# Altium schematic sheet Project_Overview.SchDoc
size A4; Organization: Arribada Initiative; Address1: https://github.com/arribada; Address2: contact@arribada.org; Address3: arribada.org; Address4: UK - Portsmouth; DocumentNumber: 1; SheetNumber: 1; SheetTotal: 5
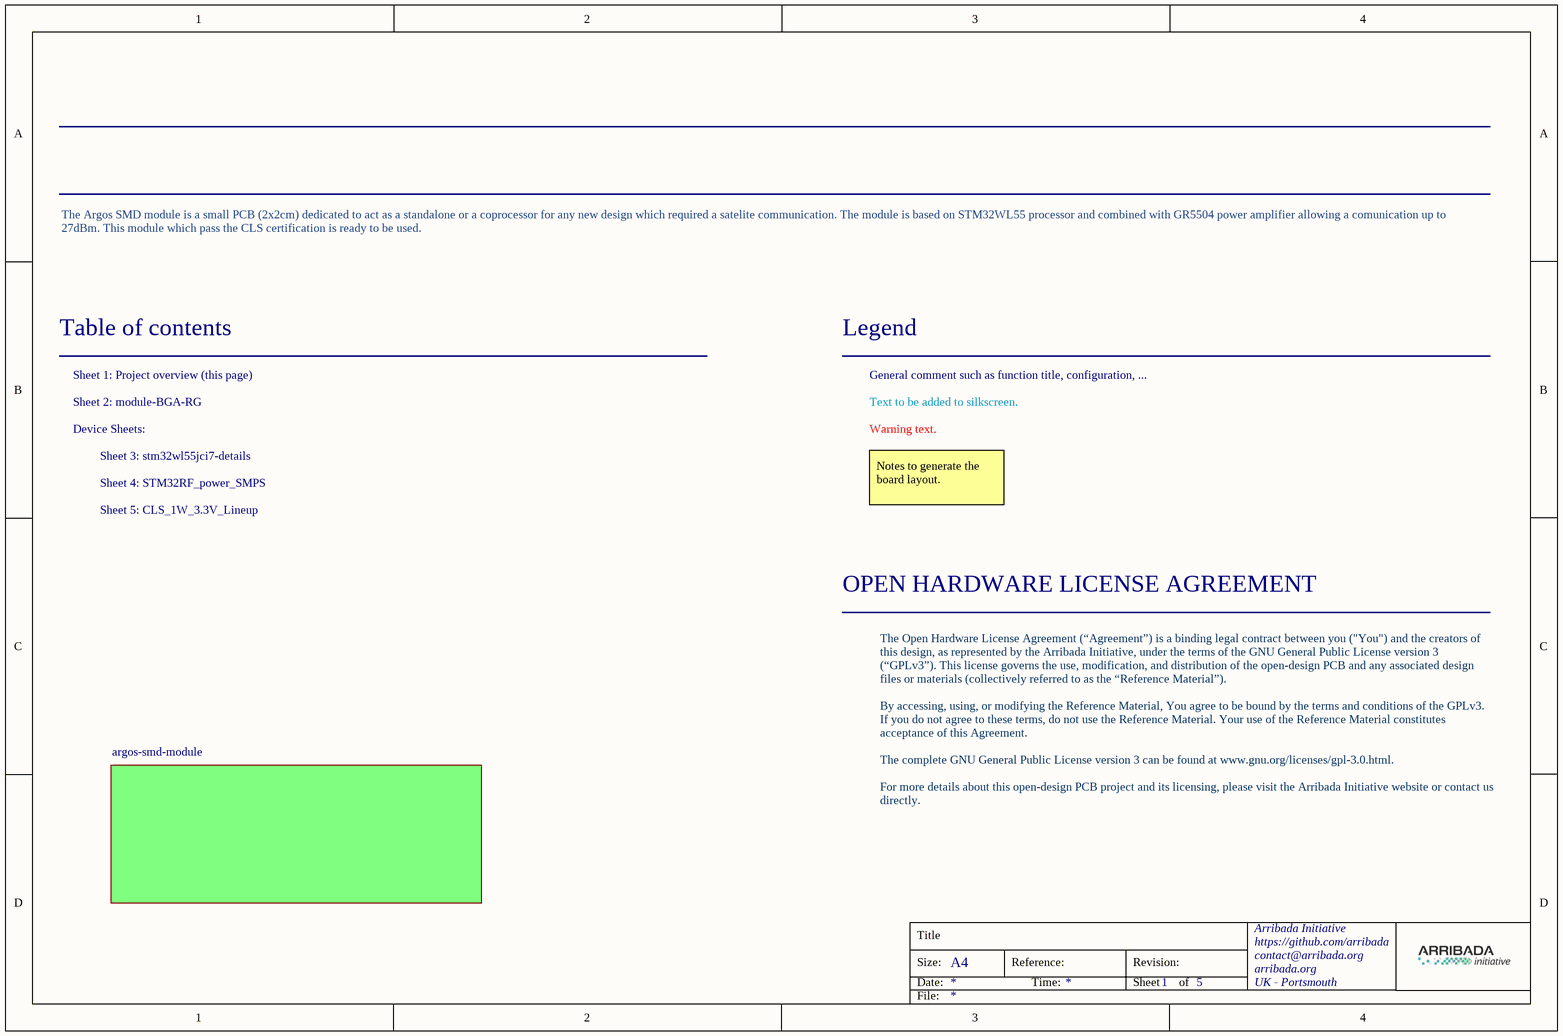
[diagram p0: Project_Overview.SchDoc]

## Sub-sheets
argos-smd-module = module-BGA-RG.SchDoc: no entries

## Notes on the sheet
- The Argos SMD module is a small PCB (2x2cm) dedicated to act as a standalone or a coprocessor for any new design which required a satelite communication. The module is based on STM32WL55 processor and combined with GR5504 power amplifier allowing a comunication up to 27dBm. This module which pass the CLS certification is ready to be used.
- Table of contents
- Sheet 1: Project overview (this page)
- Legend
- General comment such as function title, configuration, ...
- Sheet 2: module-BGA-RG
- Device Sheets:
- Text to be added to silkscreen.
- Warning text.
- Sheet 3: stm32wl55jci7-details
- Sheet 5: CLS_1W_3.3V_Lineup
- Sheet 4: STM32RF_power_SMPS
- Notes to generate the board layout.
- OPEN HARDWARE LICENSE AGREEMENT
- The Open Hardware License Agreement (“Agreement”) is a binding legal contract between you ("You") and the creators of this design, as represented by the Arribada Initiative, under the terms of the GNU General Public License version 3 (“GPLv3”). This license governs the use, modification, and distribution of the open-design PCB and any associated design files or materials (collectively referred to as the “Reference Material”).
  By accessing, using, or modifying the Reference Material, You agree to be bound by the terms and conditions of the GPLv3. If you do not agree to these terms, do not use the Reference Material. Your use of the Reference Material constitutes acceptance of this Agreement.
  The complete GNU General Public License version 3 can be found at www.gnu.org/licenses/gpl-3.0.html.
  For more details about this open-design PCB project and its licensing, please visit the Arribada Initiative website or contact us directly.
- Title
- Size:
- Date:
- A4
- Reference:
- Time:
- Revision:
- Sheet
- of
- File: